# Altium schematic sheet main.SchDoc
size A4; SheetNumber: 1; SheetTotal: 4
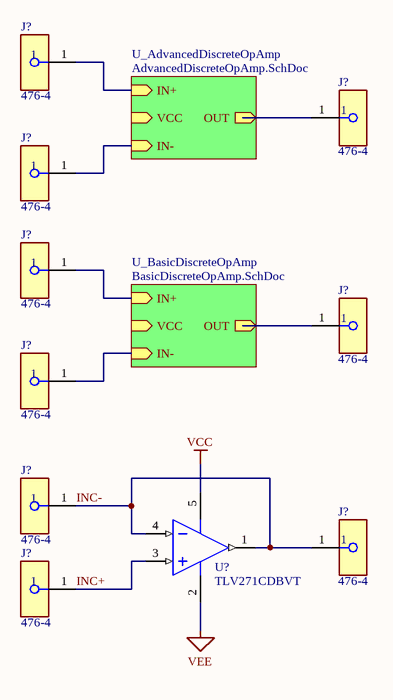
[diagram p0: main.SchDoc]

## Parts
(Parts that share a designator on the sheet are numbered #1, #2 ... from top to bottom, then left to right.)
J?#1  476-4  [FP-476-4-MFG]
J?#2  476-4  [FP-476-4-MFG]
J?#3  476-4  [FP-476-4-MFG]
J?#4  476-4  [FP-476-4-MFG]
J?#5  476-4  [FP-476-4-MFG]
J?#6  476-4  [FP-476-4-MFG]
J?#7  476-4  [FP-476-4-MFG]
J?#8  476-4  [FP-476-4-MFG]
J?#9  476-4  [FP-476-4-MFG]
U?  TLV271CDBVT  [DBV0005A_L]

## Sub-sheets
U_AdvancedDiscreteOpAmp = AdvancedDiscreteOpAmp.SchDoc: IN- (in), IN+ (in), OUT (out), VCC (in)
U_BasicDiscreteOpAmp = BasicDiscreteOpAmp.SchDoc: OUT (out), IN- (in), IN+ (in), VCC (in)

## Nets
VCC: U?.5(VDD)
VEE: U?.2(GND)
INC+: J?#9.1 U?.3(IN+)
INC-: J?#7.1 J?#8.1 U?.1(OUT) U?.4(IN-)
NetJ?#1_1: J?#1.1 ; sheet U_AdvancedDiscreteOpAmp/IN+
NetJ?#2_1: J?#2.1 ; sheet U_AdvancedDiscreteOpAmp/OUT
NetJ?#3_1: J?#3.1 ; sheet U_AdvancedDiscreteOpAmp/IN-
NetJ?#4_1: J?#4.1 ; sheet U_BasicDiscreteOpAmp/IN+
NetJ?#5_1: J?#5.1 ; sheet U_BasicDiscreteOpAmp/OUT
NetJ?#6_1: J?#6.1 ; sheet U_BasicDiscreteOpAmp/IN-

## Library data of the parts
J?#1-J?#9 = CMP-19636-000003-1: PLUG JACK MINI NON-INSULATED; Manufacturer: Keystone Electronics; Is Female: yes; Number Of Contacts: 1; Current Rating: 10A; Conn Orientation: Straight; Device Class L1: Connectors; Category: Conn; ComponentLink2Description: Datasheet; Lead Free: Yes; Device Class L3: unset; Package: 476-4; RoHS: TRUE; Contact Material: Tin; Footprint Url: https://www.keyelco.com/product-pdf.cfm?p=2378; Mouser Description: Test Plugs & Test Jacks BANANA JACK NON-INSUL; Octopart: https://octopart.com/476-4-keystone-225161; Device Class L2: unset; Manufacturer Part Number: 476-4; ComponentLink2URL: https://www.keyelco.com/userAssets/file/M65p111.pdf; Digikey Description: PLUG JACK MINI NON-INSULATED; Automotive: No
U? = CMP-0272-02196-3: 550 uA/Ch, 3 MHz, Rail-to-Rail Output Operational Amplifier, 2.7 to 16 V, 0 to 70 degC, 5-pin SOT23 (DBV5), Green (RoHS & no Sb/Br); Manufacturer: Texas Instruments; Total Supply Voltage(Max)(+5V is 5, +/-5V is 10): 16; GBW(Typ)(MHz): 3; Offset Drift(Typ)(uV/C): 2; Rating: Catalog; Vio (25C)(Max)(mV): 5; Slew Rate(Typ)(V/us): 2.4; IIB(Max)(pA): 60; Packing: SMALL T&R; Total Supply Voltage(Min)(+5V is 5, +/-5V is 10): 2.7; Sub Family: Low Supply Voltage Amplifier (<=2.7V), Precision Amplifier; Iq per channel(Max)(mA): 0.66; Number of Channels: 1; CMRR(Min)(dB): 69; ComponentLink3Description: Package Specification; Code_JEDEC: MO-178; ComponentLink1Description: Manufacturer URL; Eco-Plan: Green (RoHS & no Sb/Br); PackageReference: DBV0005A; Mounting Technology: Surface Mount; ComponentLink1URL: http://www.ti.com/; ComponentLink2URL: http://www.ti.com/lit/ds/symlink/tlv271.pdf; PackageDescription: 5-Pin Plastic Small Outline, Body 1.6 x 2.9 mm, Pitch 0.95 mm; DatasheetVersion: SLOS351D; ComponentLink2Description: Datasheet; PartNumber: TLV271CDBVT; ComponentLink3URL: http://www.ti.com/litv/pdf/mpds018i; PackageVersion: 4073253-4/K, 03/2006